# Altium schematic sheet 01_BatteryProtection.SchDoc
size A3; SheetNumber: 2; SheetTotal: 6
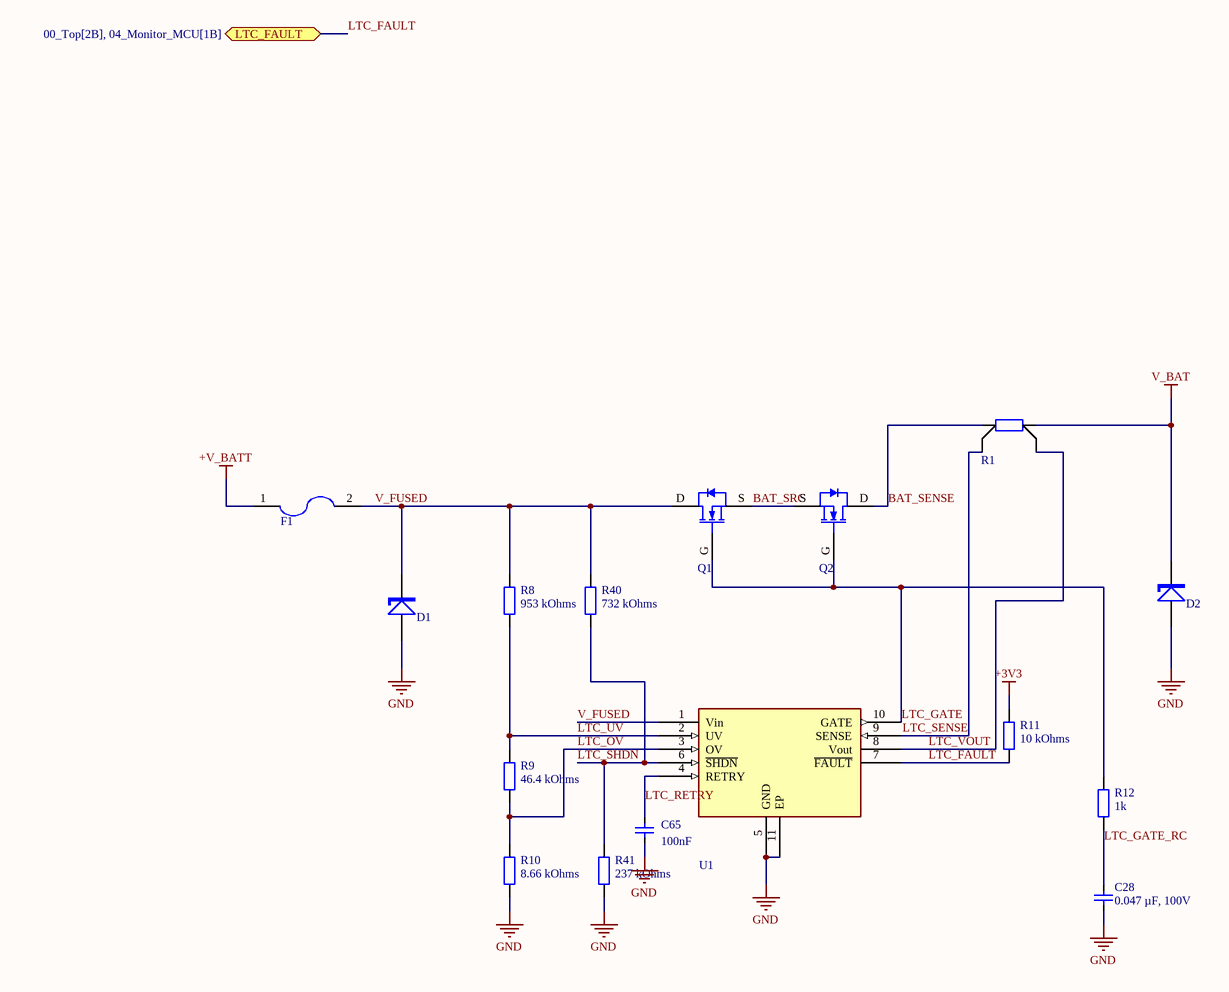
[diagram p0: 01_BatteryProtection.SchDoc]

## Parts
C28  0.047 µF, 100V  [CAPC1608X10N]
C65  100nF  [CAPC1608X10N]
D1  SMBJ60A  [SMB]  (value not drawn)
D2  SMBJ60A  [SMB]  (value not drawn)
F1  30A  [FUSE_BEL_0678H_3912]  (value not drawn)
Q1  ISC022N10NM6ATMA1  [INF-PG-TSON-8-3]  (value not drawn)
Q2  ISC022N10NM6ATMA1  [INF-PG-TSON-8-3]  (value not drawn)
R1  1.5m  [WSL3637]  (value not drawn)
R8  953 kOhms  [RESC1005X04N]
R9  46.4 kOhms  [RESC1005X04N]
R10  8.66 kOhms  [RESC1005X04N]
R11  10 kOhms  [RESC1005X04N]
R12  1k  [RESC1005X04N]
R40  732 kOhms  [RESC1005X04N]
R41  237 kOhms  [RESC1005X04N]
U1  LTC4368IDD-1#PBF  [LT-DD-DFN10_3X3]  (value not drawn)

## Ports
LTC_FAULT (bidir, see 00_Top[2B], 04_Monitor_MCU[1B])

## Nets
+3V3: R11.2
+V_BATT: F1.1
GND: C28.1 C65.1 D1.A D2.A R10.1 R41.1 U1.5(GND) U1.11(EP)
V_BAT: D2.K R1.2
BAT_SENSE: Q2.D(Drain) R1.1
BAT_SRC: Q1.S(Source) Q2.S(Source)
LTC_FAULT: R11.1 U1.7(~{FAULT}) ; port LTC_FAULT
LTC_GATE: Q1.G(Gate) Q2.G(Gate) R12.2 U1.10(GATE)
LTC_GATE_RC: C28.2 R12.1
LTC_OV: R9.1 R10.2 U1.3(OV)
LTC_RETRY: C65.2 U1.4(RETRY)
LTC_SENSE: R1.3 U1.9(SENSE)
LTC_SHDN: R40.1 R41.2 U1.6(~{SHDN})
LTC_UV: R8.1 R9.2 U1.2(UV)
LTC_VOUT: R1.4 U1.8(Vout)
V_FUSED: D1.K F1.2 Q1.D(Drain) R8.2 R40.2 U1.1(Vin)

## Library data of the parts
C28 = CGA3E3X7S2A473K080AB: CAP CER 0.047UF 100V X7S 0603; Manufacturer 1: TDK; AEC-Q200: True; Tolerance: ±10%; Capacitance: 0.047 µF; Case Code (Imperial): 0603; Manufacturer Part Number 1: CGA3E3X7S2A473K080AB; Mounting Type: Surface Mount, MLCC; Part Name: CGA3E3X7S2A473K080AB; Supplier 1: Digi-Key; Supplier Part Number 1: 445-6936-2-ND; Temperature Coefficient: X7S; Voltage Rating: 100V
C65 = CGA3E2X7R1H104M080AA: CAP CER 0.1UF 50V X7R 0603; Manufacturer 1: TDK Corporation; AEC-Q200: True; Capacitance: 0.1 µF; Tolerance: ±20%; Case Code (Imperial): 0603; Manufacturer Part Number 1: CGA3E2X7R1H104M080AA; Mounting Type: 0.063" L x 0.031" W (1.60mm x 0.80mm); Part Name: CGA3E2X7R1H104M080AA; Supplier 1: Digi-Key; Supplier Part Number 1: 445-12561-1-ND; Temperature Coefficient: X7R; Voltage Rating: 50V
D1 D2 = SMBJ60A: TVS DIODE 60VWM 96.8VC DO214AA; Manufacturer 1: Littelfuse Inc.; Diode Type: Zener; Current Average: 6.2A; Voltage Reverse: 66.7V; AEC-Q200: False; Part Name: SMBJ60A; Supplier 1: Digi-Key; Supplier Part Number 1: SMBJ60ALFTR-ND; Manufacturer Part Number 1: SMBJ60A; Voltage Forward: -; Package / Case: DO-214AA, SMB; Supplier Device Package: DO-214AA (SMBJ)
F1 = 0678H9300-02: FUSE BRD MT 30A 250VAC 125VDC; Manufacturer 1: Bel Fuse Inc.; Part Name: 0678H9300-02; Supplier 1: Digi-Key; Supplier Part Number 1: 5923-0678H9300-02TR-ND; Manufacturer Part Number 1: 0678H9300-02
Q1 Q2 = ISC022N10NM6ATMA1: TRENCH >=100V PG-TSON-8; Manufacturer 1: Infineon Technologies; FET Type: N-Channel; Drain to Source Voltage (Vdss): 100 V; Power Dissipation (Max): 3W (Ta), 254W (Tc); AEC-Q200: False; Part Name: ISC022N10NM6ATMA1; Supplier 1: Digi-Key; Supplier Part Number 1: 448-ISC022N10NM6ATMA1TR-ND; Manufacturer Part Number 1: ISC022N10NM6ATMA1; Package / Case: 8-PowerTDFN; Technology: MOSFET (Metal Oxide); Supplier Device Package: PG-TSON-8-3
R1 = WSL36371L500FEA: RES 0.0015 OHM 1% 3W 3637; Manufacturer 1: Vishay Dale; Resistance: 1.5 mOhms; AEC-Q200: True; Part Name: WSL36371L500FEA; Supplier 1: Digi-Key; Supplier Part Number 1: 541-10345-1-ND; Manufacturer Part Number 1: WSL36371L500FEA; Case Code (Imperial): 3637; Power (Watts): 3W; Tolerance: ±1%
R8 = ERJ-2RKF9533X: RES SMD 953K OHM 1% 1/10W 0402; Manufacturer 1: Panasonic Industry; Power (Watts): 0.1W, 1/10W; AEC-Q200: False; Part Name: ERJ-2RKF9533X; Supplier 1: Digi-Key; Supplier Part Number 1: P953KLTR-ND; Manufacturer Part Number 1: ERJ-2RKF9533X; Case Code (Imperial): 0402; Resistance: 953 kOhms; Tolerance: ±1%
R9 = ERJ-2RKF4642X: RES SMD 46.4K OHM 1% 1/10W 0402; Manufacturer 1: Panasonic Industry; Power (Watts): 0.1W, 1/10W; AEC-Q200: False; Part Name: ERJ-2RKF4642X; Supplier 1: Digi-Key; Supplier Part Number 1: P46.4KLTR-ND; Manufacturer Part Number 1: ERJ-2RKF4642X; Case Code (Imperial): 0402; Resistance: 46.4 kOhms; Tolerance: ±1%
R10 = ERJ-2RKF8661X: RES SMD 8.66K OHM 1% 1/10W 0402; Manufacturer 1: Panasonic Industry; Power (Watts): 0.1W, 1/10W; AEC-Q200: False; Part Name: ERJ-2RKF8661X; Supplier 1: Digi-Key; Supplier Part Number 1: P8.66KLTR-ND; Manufacturer Part Number 1: ERJ-2RKF8661X; Case Code (Imperial): 0402; Resistance: 8.66 kOhms; Tolerance: ±1%
R11 = ERJ-2RKF1002X: RES SMD 10K OHM 1% 1/10W 0402; Manufacturer 1: Panasonic Industry; Power (Watts): 0.1W, 1/10W; AEC-Q200: False; Part Name: ERJ-2RKF1002X; Supplier 1: Digi-Key; Supplier Part Number 1: P10.0KLTR-ND; Manufacturer Part Number 1: ERJ-2RKF1002X; Case Code (Imperial): 0402; Resistance: 10 kOhms; Tolerance: ±1%
R12 = ERJ-2RKF1001X: RES SMD 1K OHM 1% 1/10W 0402; Manufacturer 1: Panasonic Electronic Components; Resistance: 1 kOhms; Power (Watts): 0.1W, 1/10W; AEC-Q200: True; Part Name: ERJ-2RKF1001X; Supplier 1: Digi-Key; Supplier Part Number 1: P1.00KLCT-ND; Manufacturer Part Number 1: ERJ-2RKF1001X; Case Code (Imperial): 0402; Tolerance: ±1%
R40 = ERJ-2RKF7323X: RES SMD 732K OHM 1% 1/10W 0402; Manufacturer 1: Panasonic Industry; AEC-Q200: False; Power (Watts): 0.1W, 1/10W; Case Code (Imperial): 0402; Manufacturer Part Number 1: ERJ-2RKF7323X; Part Name: ERJ-2RKF7323X; Resistance: 732 kOhms; Supplier 1: Digi-Key; Supplier Part Number 1: P732KLTR-ND; Tolerance: ±1%
R41 = ERJ-2RKF2373X: RES SMD 237K OHM 1% 1/10W 0402; Manufacturer 1: Panasonic Industry; AEC-Q200: False; Power (Watts): 0.1W, 1/10W; Case Code (Imperial): 0402; Manufacturer Part Number 1: ERJ-2RKF2373X; Part Name: ERJ-2RKF2373X; Resistance: 237 kOhms; Supplier 1: Digi-Key; Supplier Part Number 1: P237KLTR-ND; Tolerance: ±1%
U1 = LTC4368IDD-1#PBF: IC SURGE SUPPRESSION ADJ 10DFN; Manufacturer 1: Analog Devices Inc.; AEC-Q200: False; Part Name: LTC4368IDD-1#PBF; Supplier 1: Digi-Key; Supplier Part Number 1: 505-LTC4368IDD-1#PBF-ND; Manufacturer Part Number 1: LTC4368IDD-1#PBF; Function: -; Package / Case: 10-WFDFN Exposed Pad; Supplier Device Package: 10-DFN (3x3)